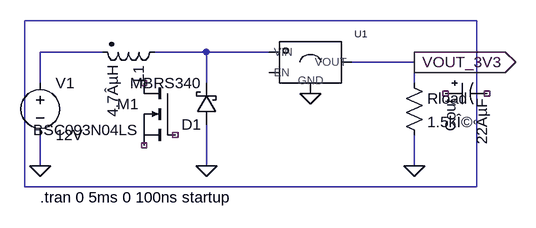
[diagram p0: schematic ltspice_buck_ldo_utf16.asc]
ltspice_buck_ldo_utf16.asc, the LTspice schematic file:
Version 4
SHEET 1 1200 800
WIRE 64 96 64 144
WIRE 64 224 64 272
WIRE 64 96 160 96
WIRE 240 96 320 96
WIRE 320 96 320 144
WIRE 320 208 320 272
WIRE 320 96 416 96
WIRE 416 128 432 128
WIRE 544 112 640 112
WIRE 640 112 640 144
WIRE 640 224 640 272
FLAG 64 272 0
FLAG 320 272 0
FLAG 480 160 0
FLAG 640 272 0
FLAG 640 112 VOUT_3V3
IOPIN 640 112 Out
SYMBOL voltage 64 128 R0
SYMATTR InstName V1
SYMATTR Value 12V
SYMBOL ind2 256 80 R90
SYMATTR InstName L1
SYMATTR Value 4.7ÂµH
SYMBOL schottky 336 208 R180
SYMATTR InstName D1
SYMATTR Value MBRS340
SYMBOL nmos 272 144 M0
SYMATTR InstName M1
SYMATTR Value BSC093N04LS
SYMBOL ltspice_custom_ldo 480 112 R0
SYMATTR InstName U1
SYMATTR Value LT3045_3V3
SYMBOL res 624 128 R0
SYMATTR InstName Rload
SYMATTR Value 1.5kÎ©
SYMBOL polcap 688 144 M90
SYMATTR InstName Cout
SYMATTR Value 22ÂµF
TEXT 64 320 Left 2 !.tran 0 5ms 0 100ns startup
RECTANGLE Normal 40 48 736 304

The netlist it stands for:
* ltspice_buck_ldo_utf16.asc
V1 N001 0 12V
L1 N002 N001 4.7ÂµH
D1 0 N002 MBRS340
M1 NC_01 NC_02 NC_03 NC_03 BSC093N04LS
U1 N002 N003 0 VOUT_3V3 LT3045_3V3
Rload VOUT_3V3 0 1.5kÎ©
Cout NC_04 NC_05 22ÂµF
.model D D
.lib standard.dio
.model NMOS NMOS
.model PMOS PMOS
.lib standard.mos
.tran 0 5ms 0 100ns startup
.backanno
.end